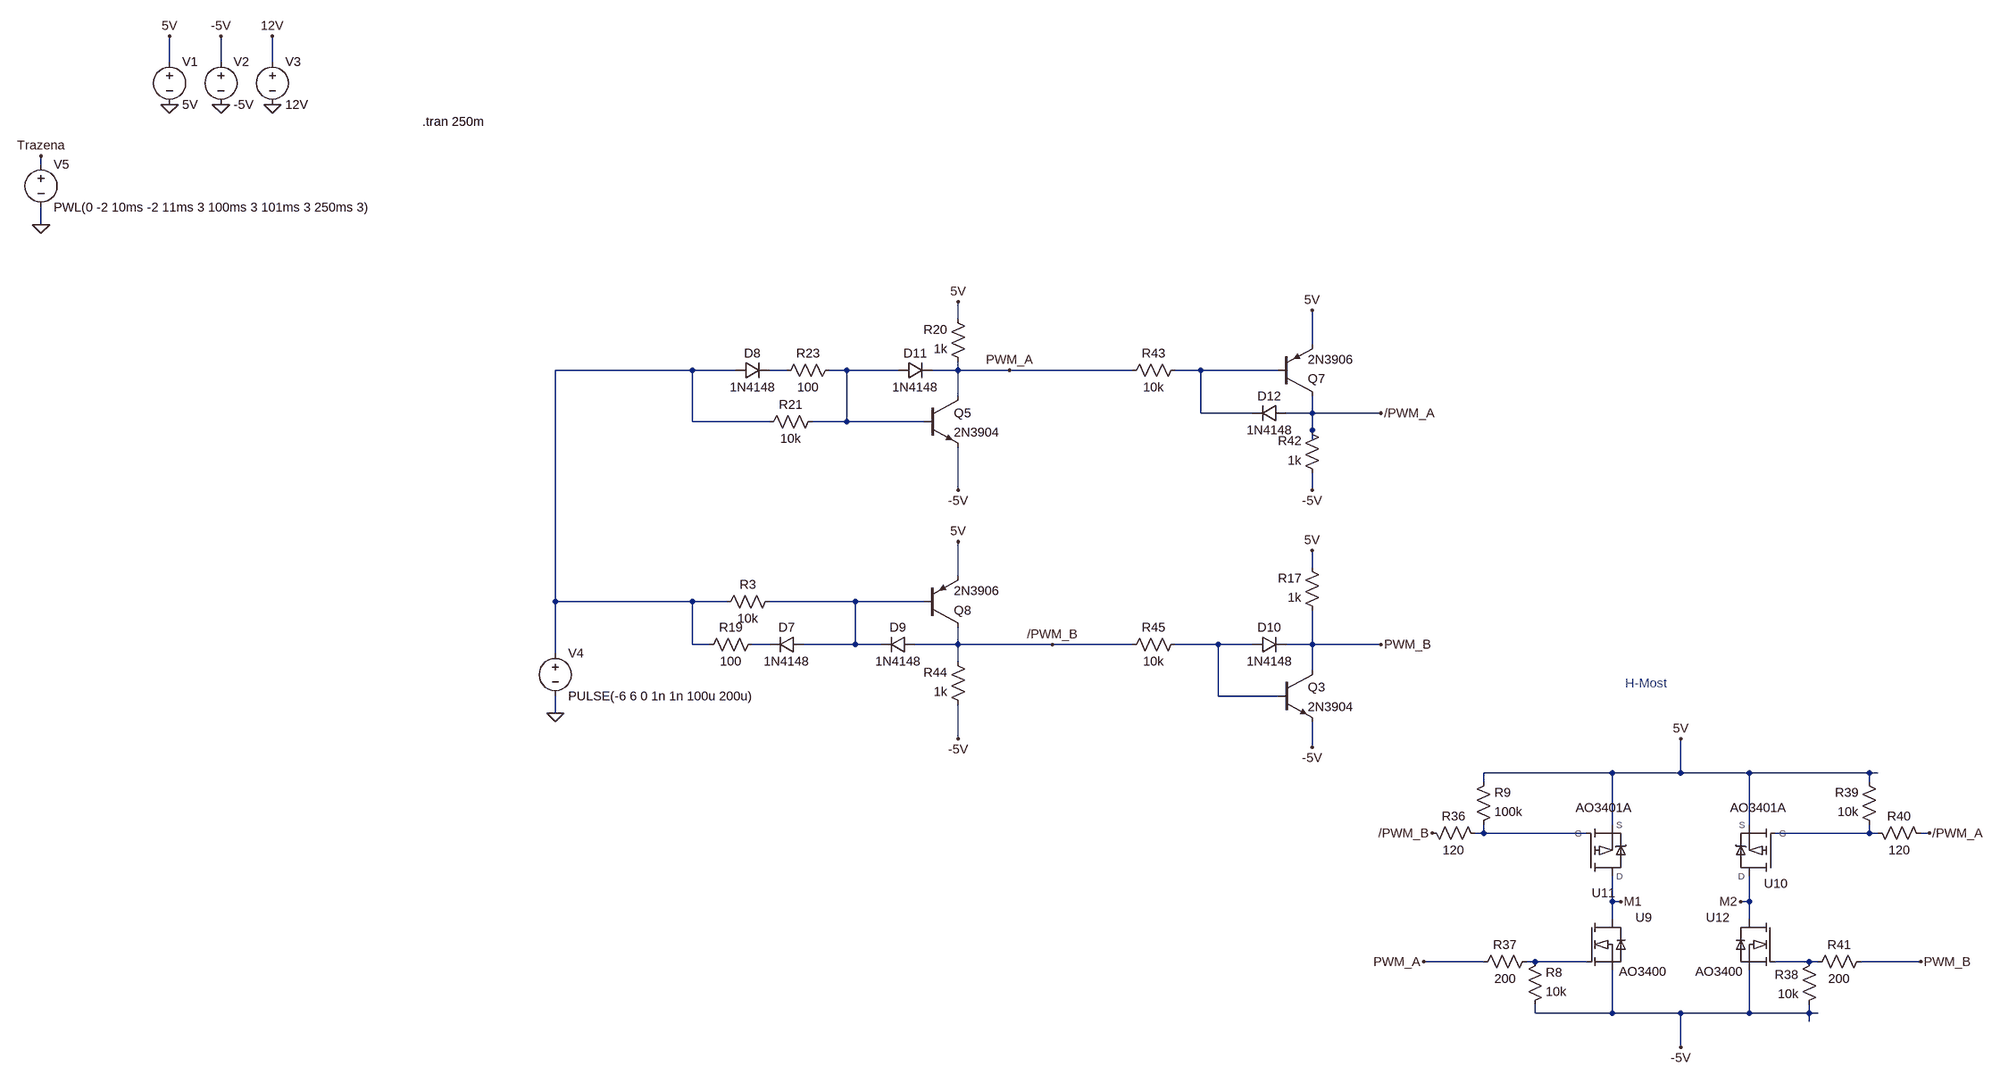
[diagram p0: schematic gate_drivers_2.asc]
gate_drivers_2.asc, the LTspice schematic file:
Version 4
SHEET 1 6380 2180
WIRE -1152 -816 -1152 -864
WIRE -1056 -816 -1056 -864
WIRE -960 -816 -960 -864
WIRE -1392 -624 -1392 -640
WIRE -1392 -512 -1392 -544
WIRE 1632 -336 1632 -368
WIRE 2320 -288 2320 -352
WIRE 1136 -240 880 -240
WIRE 1216 -240 1136 -240
WIRE 1312 -240 1280 -240
WIRE 1424 -240 1392 -240
WIRE 1520 -240 1424 -240
WIRE 1632 -240 1632 -256
WIRE 1632 -240 1584 -240
WIRE 1728 -240 1632 -240
WIRE 1984 -240 1728 -240
WIRE 2112 -240 2064 -240
WIRE 2256 -240 2112 -240
WIRE 1632 -192 1632 -240
WIRE 2112 -160 2112 -240
WIRE 2208 -160 2112 -160
WIRE 2320 -160 2320 -192
WIRE 2320 -160 2272 -160
WIRE 2448 -160 2320 -160
WIRE 1136 -144 1136 -240
WIRE 1280 -144 1136 -144
WIRE 1424 -144 1424 -240
WIRE 1424 -144 1360 -144
WIRE 1568 -144 1424 -144
WIRE 2320 -128 2320 -160
WIRE 2320 -112 2320 -128
WIRE 1632 -16 1632 -96
WIRE 2320 -16 2320 -48
WIRE 2320 128 2320 96
WIRE 1632 144 1632 80
WIRE 880 192 880 -240
WIRE 1136 192 880 192
WIRE 1200 192 1136 192
WIRE 1440 192 1280 192
WIRE 1568 192 1440 192
WIRE 1136 272 1136 192
WIRE 1168 272 1136 272
WIRE 1280 272 1248 272
WIRE 1440 272 1440 192
WIRE 1440 272 1344 272
WIRE 1488 272 1440 272
WIRE 1632 272 1632 240
WIRE 1632 272 1552 272
WIRE 1808 272 1632 272
WIRE 1984 272 1808 272
WIRE 2144 272 2064 272
WIRE 2208 272 2144 272
WIRE 2320 272 2320 208
WIRE 2320 272 2272 272
WIRE 2448 272 2320 272
WIRE 880 288 880 192
WIRE 1632 304 1632 272
WIRE 2320 320 2320 272
WIRE 2144 368 2144 272
WIRE 2256 368 2144 368
WIRE 880 400 880 368
WIRE 1632 448 1632 384
WIRE 2320 464 2320 416
WIRE 2880 512 2640 512
WIRE 3008 512 3008 448
WIRE 3008 512 2880 512
WIRE 3136 512 3008 512
WIRE 3360 512 3136 512
WIRE 3376 512 3360 512
WIRE 2640 528 2640 512
WIRE 3360 528 3360 512
WIRE 2880 608 2880 512
WIRE 3136 608 3136 512
WIRE 2640 624 2640 608
WIRE 2640 624 2624 624
WIRE 2832 624 2640 624
WIRE 3360 624 3360 608
WIRE 3360 624 3184 624
WIRE 3376 624 3360 624
WIRE 3472 624 3456 624
WIRE 2880 752 2880 704
WIRE 2896 752 2880 752
WIRE 3136 752 3136 704
WIRE 3136 752 3120 752
WIRE 2880 784 2880 752
WIRE 3136 784 3136 752
WIRE 2640 864 2528 864
WIRE 2736 864 2720 864
WIRE 2832 864 2736 864
WIRE 3248 864 3184 864
WIRE 3264 864 3248 864
WIRE 3456 864 3344 864
WIRE 2736 960 2736 944
WIRE 2880 960 2880 880
WIRE 2880 960 2736 960
WIRE 3008 960 2880 960
WIRE 3136 960 3136 880
WIRE 3136 960 3008 960
WIRE 3248 960 3248 944
WIRE 3248 960 3136 960
WIRE 3264 960 3248 960
WIRE 3248 976 3248 960
WIRE 3008 1024 3008 960
FLAG -1152 -736 0
FLAG -1152 -864 5V
FLAG -1056 -736 0
FLAG -1056 -864 -5V
FLAG -960 -736 0
FLAG -960 -864 12V
FLAG -1392 -512 0
FLAG -1392 -640 Trazena
FLAG 2896 752 M1
FLAG 3120 752 M2
FLAG 2528 864 PWM_A
FLAG 2544 624 /PWM_B
FLAG 3456 864 PWM_B
FLAG 3472 624 /PWM_A
FLAG 3008 1024 -5V
FLAG 3008 448 5V
FLAG 2448 272 PWM_B
FLAG 2320 464 -5V
FLAG 2320 96 5V
FLAG 1632 -16 -5V
FLAG 1632 -368 5V
FLAG 2320 -16 -5V
FLAG 2320 -352 5V
FLAG 1632 448 -5V
FLAG 1632 80 5V
FLAG 1728 -240 PWM_A
FLAG 1808 272 /PWM_B
FLAG 2448 -160 /PWM_A
FLAG 880 400 0
SYMBOL voltage -1152 -832 R0
WINDOW 123 0 0 Left 0
WINDOW 39 0 0 Left 0
SYMATTR InstName V1
SYMATTR Value 5V
SYMBOL voltage -1056 -832 R0
WINDOW 123 0 0 Left 0
WINDOW 39 0 0 Left 0
SYMATTR InstName V2
SYMATTR Value -5V
SYMBOL voltage -960 -832 R0
WINDOW 123 0 0 Left 0
WINDOW 39 0 0 Left 0
SYMATTR InstName V3
SYMATTR Value 12V
SYMBOL voltage -1392 -640 R0
WINDOW 123 0 0 Left 0
WINDOW 39 0 0 Left 0
SYMATTR InstName V5
SYMATTR Value PWL(0 -2 10ms -2 11ms 3 100ms 3 101ms 3 250ms 3)
SYMBOL AO3400 2912 848 R0
SYMATTR InstName U9
SYMBOL AO3401A 3104 672 R180
WINDOW 0 -82 -31 Bottom 2
SYMATTR InstName U10
SYMBOL AO3401A 2912 672 M180
SYMATTR InstName U11
SYMBOL AO3400 3104 848 M0
SYMATTR InstName U12
SYMBOL res 2720 960 M180
WINDOW 0 36 76 Left 2
WINDOW 3 36 40 Left 2
SYMATTR InstName R8
SYMATTR Value 10k
SYMBOL res 2624 624 M180
WINDOW 0 36 76 Left 2
WINDOW 3 36 40 Left 2
SYMATTR InstName R9
SYMATTR Value 100k
SYMBOL res 2528 608 M90
WINDOW 0 0 56 VBottom 2
WINDOW 3 32 56 VTop 2
SYMATTR InstName R36
SYMATTR Value 120
SYMBOL res 2736 848 R90
WINDOW 0 0 56 VBottom 2
WINDOW 3 32 56 VTop 2
SYMATTR InstName R37
SYMATTR Value 200
SYMBOL res 3264 848 M0
SYMATTR InstName R38
SYMATTR Value 10k
SYMBOL res 3376 624 R180
WINDOW 0 36 76 Left 2
WINDOW 3 36 40 Left 2
SYMATTR InstName R39
SYMATTR Value 10k
SYMBOL res 3360 608 M90
WINDOW 0 0 56 VBottom 2
WINDOW 3 32 56 VTop 2
SYMATTR InstName R40
SYMATTR Value 120
SYMBOL res 3360 848 R90
WINDOW 0 0 56 VBottom 2
WINDOW 3 32 56 VTop 2
SYMATTR InstName R41
SYMATTR Value 200
SYMBOL npn 2256 320 R0
SYMATTR InstName Q3
SYMATTR Value 2N3904
SYMBOL res 1296 176 R90
WINDOW 0 0 56 VBottom 2
WINDOW 3 32 56 VTop 2
SYMATTR InstName R3
SYMATTR Value 10k
SYMBOL res 2336 224 R180
WINDOW 0 36 76 Left 2
WINDOW 3 36 40 Left 2
SYMATTR InstName R17
SYMATTR Value 1k
SYMBOL diode 1344 256 R90
WINDOW 0 0 32 VBottom 2
WINDOW 3 32 32 VTop 2
SYMATTR InstName D7
SYMATTR Value 1N4148
SYMBOL res 1264 256 R90
WINDOW 0 0 56 VBottom 2
WINDOW 3 32 56 VTop 2
SYMATTR InstName R19
SYMATTR Value 100
SYMBOL npn 1568 -192 R0
SYMATTR InstName Q5
SYMATTR Value 2N3904
SYMBOL res 1648 -240 R180
WINDOW 0 36 76 Left 2
WINDOW 3 36 40 Left 2
SYMATTR InstName R20
SYMATTR Value 1k
SYMBOL res 1376 -160 R90
WINDOW 0 0 56 VBottom 2
WINDOW 3 32 56 VTop 2
SYMATTR InstName R21
SYMATTR Value 10k
SYMBOL diode 1216 -224 R270
WINDOW 0 32 32 VTop 2
WINDOW 3 0 32 VBottom 2
SYMATTR InstName D8
SYMATTR Value 1N4148
SYMBOL res 1408 -256 R90
WINDOW 0 0 56 VBottom 2
WINDOW 3 32 56 VTop 2
SYMATTR InstName R23
SYMATTR Value 100
SYMBOL pnp 2256 -192 M180
SYMATTR InstName Q7
SYMATTR Value 2N3906
SYMBOL res 2336 -32 R180
WINDOW 0 36 76 Left 2
WINDOW 3 36 40 Left 2
SYMATTR InstName R42
SYMATTR Value 1k
SYMBOL res 2080 -256 R90
WINDOW 0 0 56 VBottom 2
WINDOW 3 32 56 VTop 2
SYMATTR InstName R43
SYMATTR Value 10k
SYMBOL pnp 1568 240 M180
SYMATTR InstName Q8
SYMATTR Value 2N3906
SYMBOL res 1648 400 R180
WINDOW 0 36 76 Left 2
WINDOW 3 36 40 Left 2
SYMATTR InstName R44
SYMATTR Value 1k
SYMBOL res 2080 256 R90
WINDOW 0 0 56 VBottom 2
WINDOW 3 32 56 VTop 2
SYMATTR InstName R45
SYMATTR Value 10k
SYMBOL diode 1552 256 R90
WINDOW 0 0 32 VBottom 2
WINDOW 3 32 32 VTop 2
SYMATTR InstName D9
SYMATTR Value 1N4148
SYMBOL diode 2208 288 R270
WINDOW 0 32 32 VTop 2
WINDOW 3 0 32 VBottom 2
SYMATTR InstName D10
SYMATTR Value 1N4148
SYMBOL diode 1520 -224 R270
WINDOW 0 32 32 VTop 2
WINDOW 3 0 32 VBottom 2
SYMATTR InstName D11
SYMATTR Value 1N4148
SYMBOL diode 2272 -176 R90
WINDOW 0 0 32 VBottom 2
WINDOW 3 32 32 VTop 2
SYMATTR InstName D12
SYMATTR Value 1N4148
SYMBOL voltage 880 272 R0
WINDOW 123 0 0 Left 0
WINDOW 39 0 0 Left 0
SYMATTR InstName V4
SYMATTR Value PULSE(-6 6 0 1n 1n 100u 200u)
TEXT -680 -704 Left 2 !.tran 250m
TEXT 2904 344 Left 2 ;H-Most

The netlist it stands for:
* gate_drivers_2.asc
V1 5V 0 5V
V2 -5V 0 -5V
V3 12V 0 12V
V5 Trazena 0 PWL(0 -2 10ms -2 11ms 3 100ms 3 101ms 3 250ms 3)
XU9 M1 N010 -5V AO3400  ; pins 1 4 2
XU10 M2 N009 5V AO3401A  ; pins D G S
XU11 M1 N008 5V AO3401A  ; pins D G S
XU12 M2 N011 -5V AO3400  ; pins 1 4 2
R8 -5V N010 10k
R9 N008 5V 100k
R36 /PWM_B N008 120
R37 N010 PWM_A 200
R38 N011 -5V 10k
R39 N009 5V 10k
R40 N009 /PWM_A 120
R41 PWM_B N011 200
Q3 PWM_B N007 -5V 0 2N3904
R3 N005 N001 10k
R17 PWM_B 5V 1k
D7 N005 N006 1N4148
R19 N006 N001 100
Q5 PWM_A N003 -5V 0 2N3904
R20 PWM_A 5V 1k
R21 N003 N001 10k
D8 N001 N002 1N4148
R23 N003 N002 100
Q7 /PWM_A N004 5V 0 2N3906
R42 -5V /PWM_A 1k
R43 N004 PWM_A 10k
Q8 /PWM_B N005 5V 0 2N3906
R44 -5V /PWM_B 1k
R45 N007 /PWM_B 10k
D9 /PWM_B N005 1N4148
D10 N007 PWM_B 1N4148
D11 N003 PWM_A 1N4148
D12 /PWM_A N004 1N4148
V4 N001 0 PULSE(-6 6 0 1n 1n 100u 200u)
.model D D
.lib standard.dio
.model NPN NPN
.model PNP PNP
.lib standard.bjt
.tran 250m
* H-Most
.lib AO3400.mod
.lib AO3401A.mod
.backanno
.end